# Altium schematic sheet Power_Controller-Sheet-ch2.SchDoc (part 1 of 3)
size 420 x 297 mm; SheetNumber: 7; SheetTotal: 10
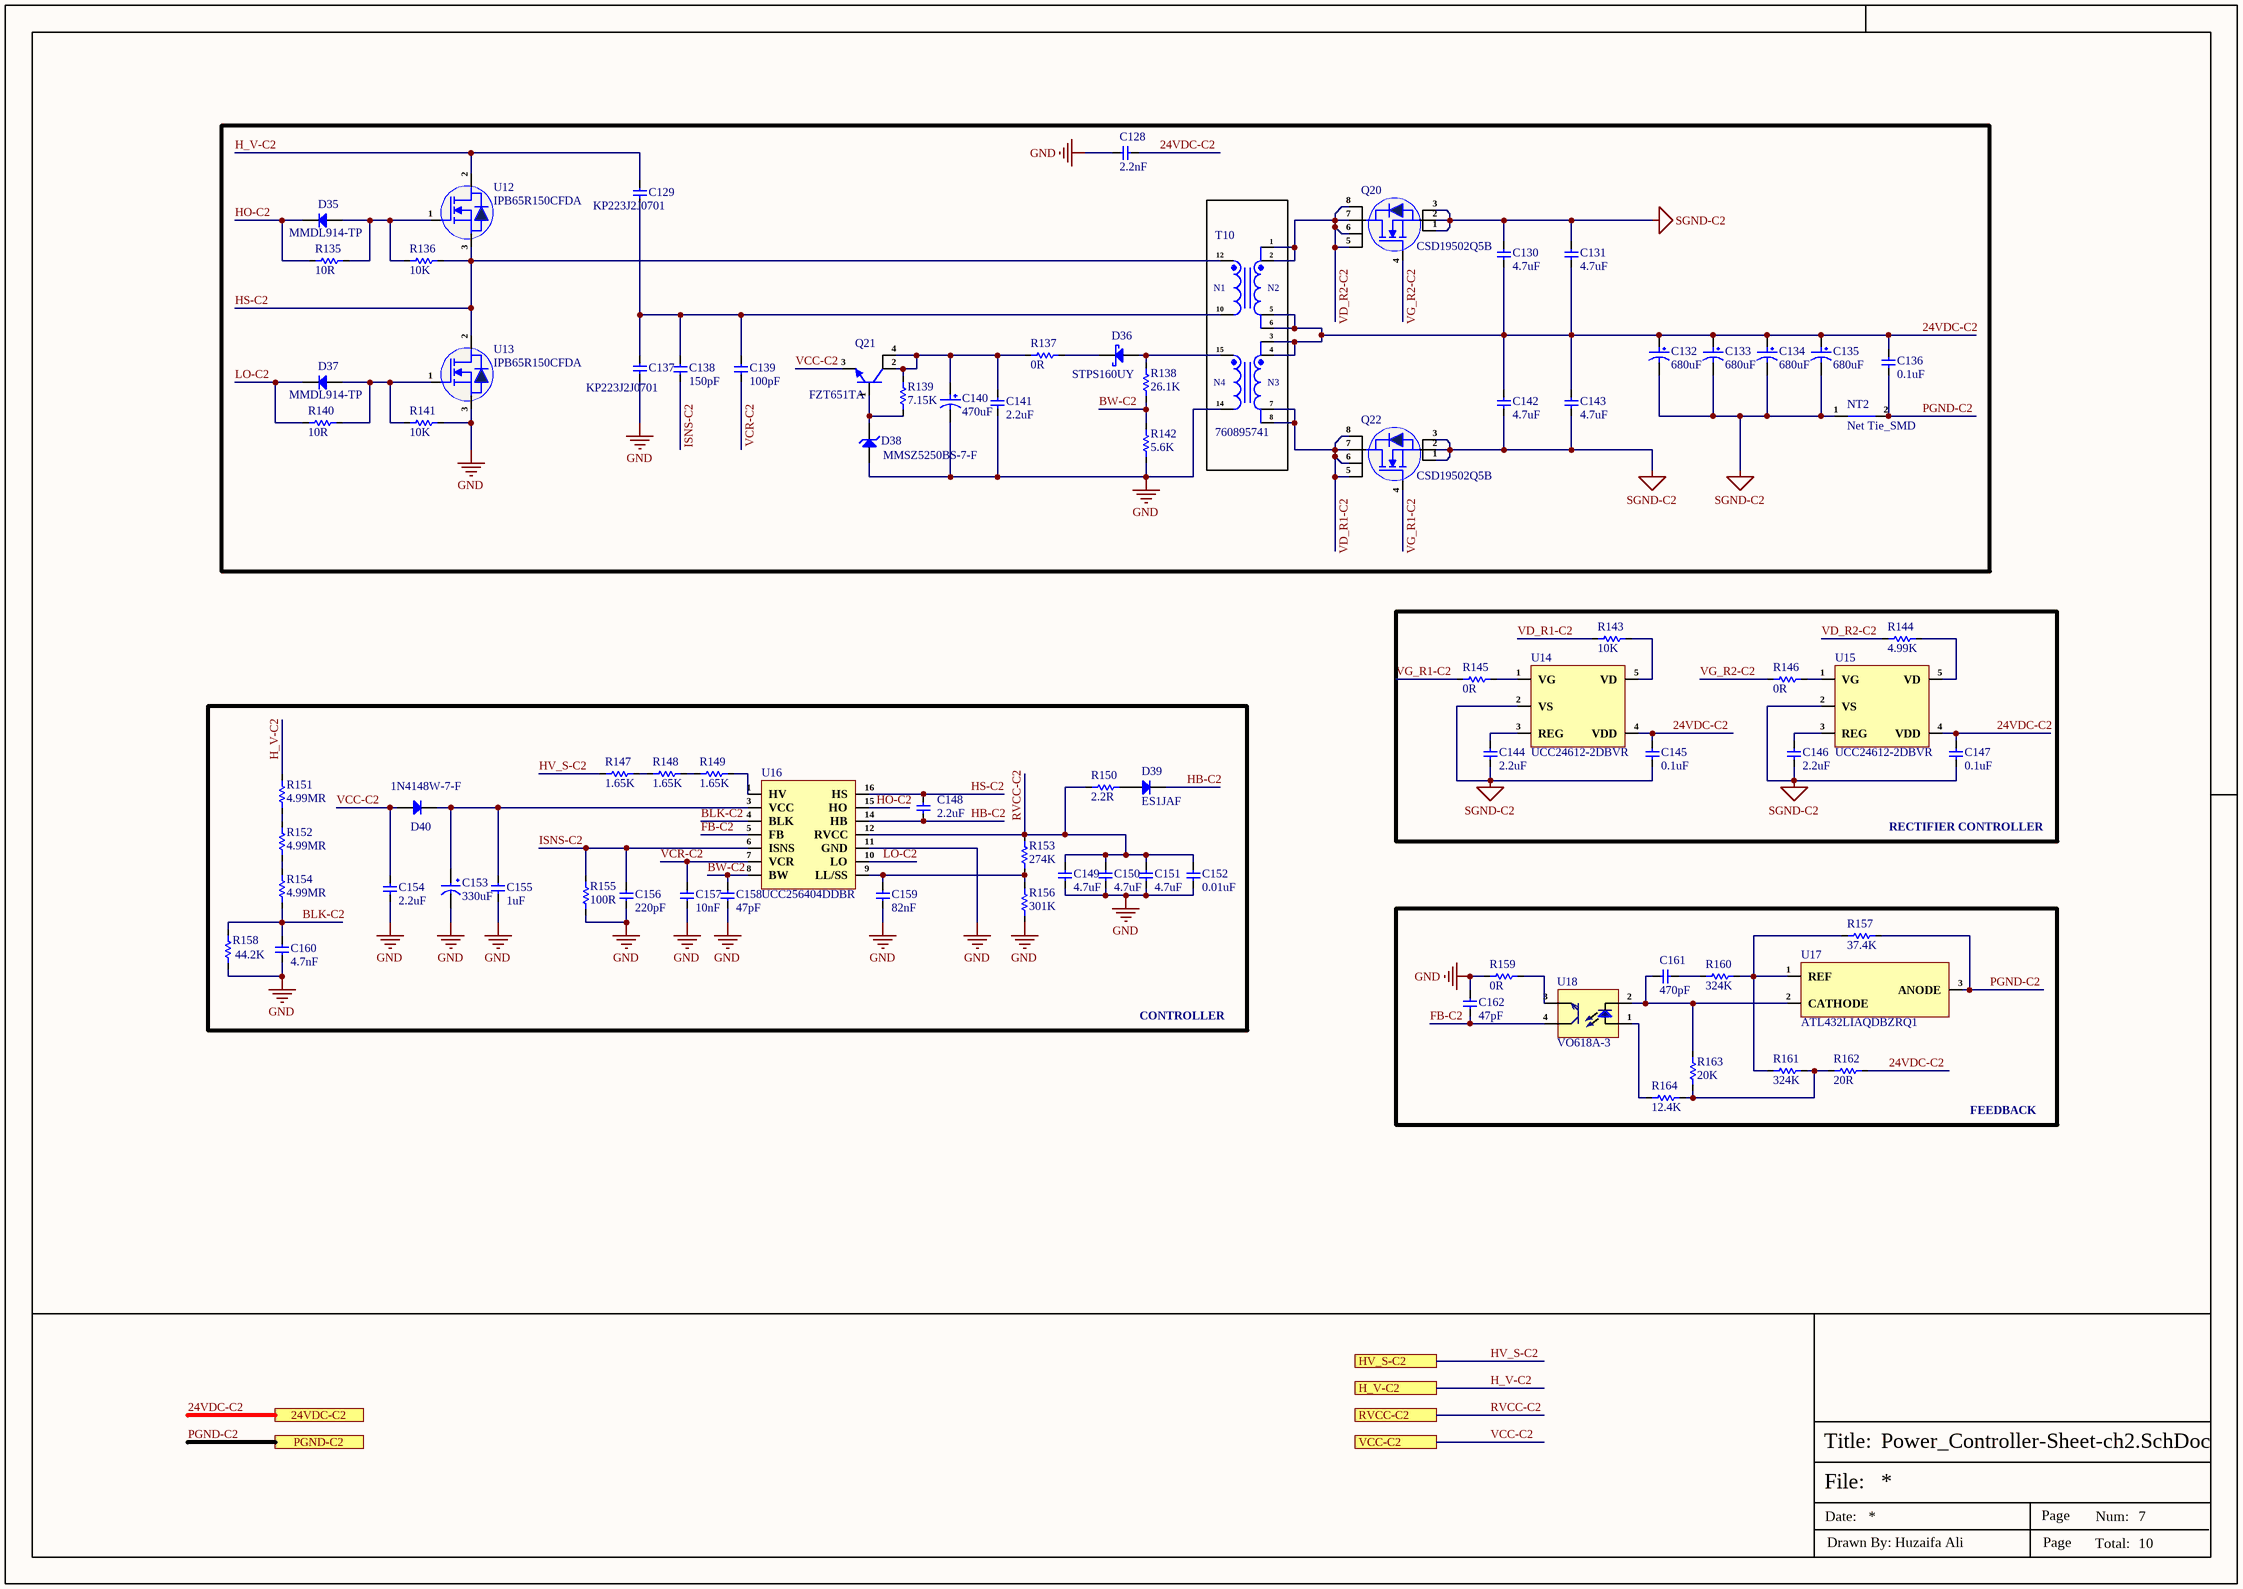
[diagram p0: Power_Controller-Sheet-ch2.SchDoc]

## Parts
C128  2.2nF  [DE1E3RA222MA4BN01F]
C129  KP223J2J0701  [KP223J2J0701]
C130  4.7uF  [Cap-1206]
C131  4.7uF  [Cap-1206]
C132  680uF  [EEU-FR1V681B]
C133  680uF  [EEU-FR1V681B]
C134  680uF  [EEU-FR1V681B]
C135  680uF  [EEU-FR1V681B]
C136  0.1uF  [Cap-1206]
C137  KP223J2J0701  [KP223J2J0701]
C138  150pF  [Cap-1206]
C139  100pF  [Cap-1206]
C140  470uF  [EEUFR1V471B]
C141  2.2uF  [Cap-1206]
C142  4.7uF  [Cap-1206]
C143  4.7uF  [Cap-1206]
C144  2.2uF  [CAP-0603]
C145  0.1uF  [Cap-1206]
C146  2.2uF  [CAP-0603]
C147  0.1uF  [Cap-1206]
C148  2.2uF  [Cap-1206]
C149  4.7uF  [Cap-0603]
C150  4.7uF  [Cap-0603]
C151  4.7uF  [Cap-0603]
C152  0.01uF  [Cap-0603]
C153  330uF  [RC035M331LO8*14TH-2A1E]
C154  2.2uF  [Cap-0603]
C155  1uF  [Cap-1206]
C156  220pF  [Cap-0603]
C157  10nF  [Cap-0603]
C158  47pF  [Cap-0402]
C159  82nF  [Cap-0603]
C160  4.7nF  [Cap-0603]
C161  470pF  [Cap-0603]
C162  47pF  [Cap-0603]
D35  MMDL914-TP  [SOD-323]
D36  STPS160UY  [SMB_]
D37  MMDL914-TP  [SOD-323]
D38  MMSZ5250BS-7-F  [SOD-323]
D39  ES1JAF  [DO-214AD (SMAF)]
D40  1N4148W-7-F  [SOD-123]
NT2  Net Tie_SMD  [Net Tie Pad]  (net tie, no BOM)
Q20  CSD19502Q5B  [VSON-CLIP-8(6x5)]
Q21  FZT651TA  [SOT- 223]
Q22  CSD19502Q5B  [VSON-CLIP-8(6x5)]
R135  10R  [Res-0603]
R136  10K  [RES-0805]
R137  0R  [Res-1206]
R138  26.1K  [Res-0603]
R139  7.15K  [Res-0603]
R140  10R  [Res-0603]
R141  10K  [RES-0805]
R142  5.6K  [RES-0805]
R143  10K  [Res-0603]
R144  4.99K  [Res-0603]
R145  0R  [Res-0402]
R146  0R  [Res-0402]
R147  1.65K  [Res-1206]
R148  1.65K  [Res-1206]
R149  1.65K  [Res-1206]
R150  2.2R  [Res-0603]
R151  4.99MR  [Res-1206]
R152  4.99MR  [Res-1206]
R153  274K  [Res-0603]
R154  4.99MR  [Res-1206]
R155  100R  [Res-0603]
R156  301K  [res-0603]
R157  37.4K  [Res-0603]
R158  44.2K  [Res-0603]
R159  0R  [Res-0603]
R160  324K  [Res-0603]
R161  324K  [Res-0603]
R162  20R  [Res-0603]
R163  20K  [Res-1206]
R164  12.4K  [Res-0603]
T10  760895741  [760895741]
U12  IPB65R150CFDA  [TO-263]
U13  IPB65R150CFDA  [TO-263]
U14  UCC24612-2DBVR  [SOT-23-5]
U15  UCC24612-2DBVR  [SOT-23-5]
U16  UCC256404DDBR  [UCC256404DDBR]
U17  ATL432LIAQDBZRQ1  [SOT-23]
U18  VO618A-3  [DIP-4]

## Blocks framed on the sheet
RECTIFIER CONTROLLER: C144-C147 R143-R146 U14 U15
CONTROLLER: C148-C160 D39 D40 R147-R156 R158 U16
FEEDBACK: C161 C162 R157 R159-R164 U17 U18

## Ports
24VDC-C2 (see Top-Sheet[6A], Connector-Sheet[2D]), H_V-C2 (see Top-Sheet[5A], PFC-Sheet-ch2[1D]), HV_S-C2 (see Top-Sheet[5A], PFC-Sheet-ch2[1D]), PGND-C2 (see Top-Sheet[6A], Connector-Sheet[2D]), RVCC-C2 (see Top-Sheet[5A], PFC-Sheet-ch2[1D]), VCC-C2 (see Top-Sheet[5A], PFC-Sheet-ch2[1D])

## Nets
GND: C128.1 C137.2 C140.2 C141.1 C149.1 C150.1 C151.1 C152.1 C153.2 C154.1 C155.2 C156.1 C157.1 C158.1 C159.1 C160.1 C162.2 D38.2(A) R141.2 R142.1 R155.1 R156.1 R158.1 R159.1 T10.14 U13.3(S) U16.11(GND)
SGND-C2: C130.2 C131.2 C132.2 C133.2 C134.2 C135.2 C142.1 C143.1 C144.1 C145.1 C146.1 C147.1 NT2.1 Q20.1(S) Q20.2(S) Q20.3(S) Q22.1(S) Q22.2(S) Q22.3(S) U14.2(VS) U15.2(VS)
24VDC-C2: C128.2 C130.1 C131.1 C132.1 C133.1 C134.1 C135.1 C136.2 C142.2 C143.2 C145.2 C147.2 R162.2 T10.3 T10.4 T10.5 T10.6 U14.4(VDD) U15.4(VDD) ; port 24VDC-C2
BLK-C2: C160.2 R154.1 R158.2 U16.4(BLK)
BW-C2: C158.2 R138.1 R142.2 U16.8(BW)
FB-C2: C162.1 U16.5(FB) U18.4(C)
H_V-C2: C129.1 R151.2 U12.2(D) ; port H_V-C2
HB-C2: C148.1 D39.1(K) U16.14(HB)
HO-C2: D35.1(K) R135.1 U16.15(HO)
HS-C2: C148.2 R136.2 T10.12 U12.3(S) U13.2(D) U16.16(HS)
HV_S-C2: R147.1 ; port HV_S-C2
ISNS-C2: C138.1 C156.2 R155.2 U16.6(ISNS)
LO-C2: D37.1(K) R140.1 U16.10(LO)
PGND-C2: C136.1 NT2.2 R157.2 U17.3(ANODE) ; port PGND-C2
RVCC-C2: C149.2 C150.2 C151.2 C152.2 R150.1 R153.2 U16.12(RVCC) ; port RVCC-C2
VCC-C2: C154.2 D40.1(A) Q21.3(E) ; port VCC-C2
VCR-C2: C139.1 C157.2 U16.7(VCR)
VD_R1-C2: Q22.5(D) Q22.6(D) Q22.7(D) Q22.8(D) R143.1 T10.7 T10.8
VD_R2-C2: Q20.5(D) Q20.6(D) Q20.7(D) Q20.8(D) R144.1 T10.1 T10.2
VG_R1-C2: Q22.4(G) R145.1
VG_R2-C2: Q20.4(G) R146.1
NetC129_2: C129.2 C137.1 C138.2 C139.2 T10.10
NetC140_1: C140.1 C141.2 Q21.2(C) Q21.4(C) R137.1 R139.2
NetC144_2: C144.2 U14.3(REG)
NetC146_2: C146.2 U15.3(REG)
NetC153_1: C153.1 C155.1 D40.2(K) U16.3(VCC)
NetC159_2: C159.2 R153.1 R156.2 U16.9(LL/SS)
NetC161_1: C161.1 R163.2 U17.2(CATHODE) U18.2(Ca)
NetC161_2: C161.2 R160.1
NetD35_2: D35.2(A) R135.2 R136.1 U12.1(G)
NetD36_1: D36.1(A) R138.2 T10.15
NetD36_2: D36.2(K) R137.2
NetD37_2: D37.2(A) R140.2 R141.1 U13.1(G)
NetD38_1: D38.1(K) Q21.1(B) R139.1
NetD39_2: D39.2(A) R150.2
NetR143_2: R143.2 U14.5(VD)
NetR144_2: R144.2 U15.5(VD)
NetR145_2: R145.2 U14.1(VG)
NetR146_2: R146.2 U15.1(VG)
NetR147_2: R147.2 R148.1
NetR148_2: R148.2 R149.1
NetR149_2: R149.2 U16.1(HV)
NetR151_1: R151.1 R152.2
NetR152_1: R152.1 R154.2
NetR157_1: R157.1 R160.2 R161.1 U17.1(REF)
NetR159_2: R159.2 U18.3(E)
NetR161_2: R161.2 R162.1 R163.1 R164.2
NetR164_1: R164.1 U18.1(An)

## Notes on the sheet
- File:
- Title:
- Date:
- Page
- Num:
- Total:
- Drawn By: Huzaifa Ali
- (in symbol 760895741) N1; N2; N4; N3